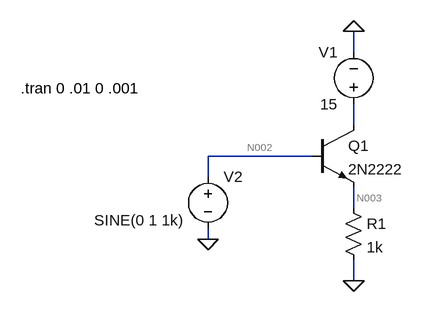
[diagram p0: schematic Draft2.asc]
Draft2.asc, the LTspice schematic file:
Version 4.1
SHEET 1 880 680
WIRE 224 -16 224 -48
WIRE 224 96 224 64
WIRE 160 144 0 144
WIRE 0 176 0 144
WIRE 224 224 224 192
WIRE 0 272 0 256
WIRE 224 336 224 304
FLAG 224 336 0
FLAG 224 -48 0
FLAG 0 272 0
SYMBOL npn 160 96 R0
SYMATTR InstName Q1
SYMATTR Value 2N2222
SYMBOL res 208 208 R0
SYMATTR InstName R1
SYMATTR Value 1k
SYMBOL voltage 224 80 R180
WINDOW 0 24 96 Left 2
WINDOW 3 24 16 Left 2
WINDOW 123 0 0 Left 0
WINDOW 39 0 0 Left 0
SYMATTR InstName V1
SYMATTR Value 15
SYMBOL voltage 0 160 R0
WINDOW 3 -175 83 Left 2
WINDOW 123 0 0 Left 0
WINDOW 39 0 0 Left 0
SYMATTR InstName V2
SYMATTR Value SINE(0 1 1k)
TEXT -288 40 Left 2 !.tran 0 .01 0 .001

The netlist it stands for:
* Draft2.asc
Q1 N001 N002 N003 0 2N2222
R1 N003 0 1k
V1 N001 0 15
V2 N002 0 SINE(0 1 1k)
.model NPN NPN
.model PNP PNP
.lib standard.bjt
.tran 0 .01 0 .001
.backanno
.end

* Results of the author's LTspice run, read from the files saved beside the schematic
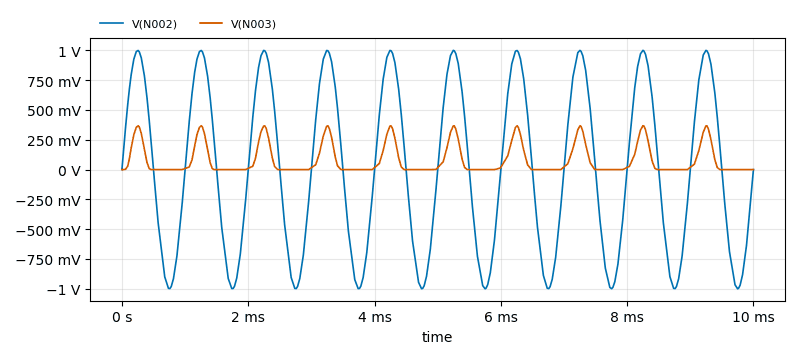
[diagram p1: Transient Analysis of Draft2.asc, plotted from the saved traces]
* Transient Analysis, 1 run:
*   V(N002): min -1 V, max 1 V, average 1.929 mV, rms 712.8 mV, last 0 V
*   V(N003): min -162.1 µV, max 368.2 mV, average 78.89 mV, rms 145.8 mV, last 152.6 µV